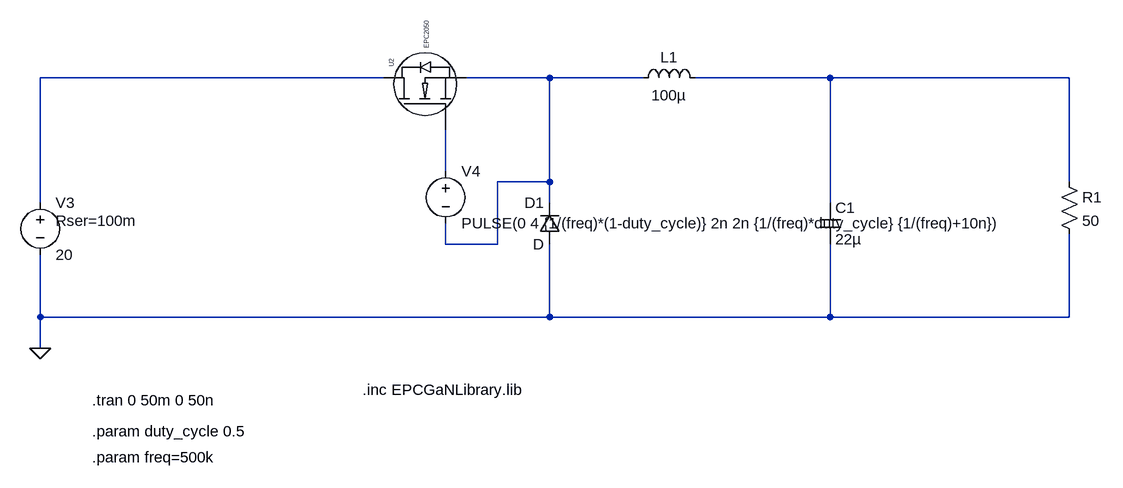
[diagram p0: schematic EPC_buck.asc]
EPC_buck.asc, the LTspice schematic file:
Version 4.1
SHEET 1 1836 868
WIRE 48 -368 -480 -368
WIRE 304 -368 176 -368
WIRE 448 -368 304 -368
WIRE 736 -368 528 -368
WIRE 1104 -368 736 -368
WIRE 144 -224 144 -288
WIRE 304 -208 304 -368
WIRE 304 -208 224 -208
WIRE 1104 -208 1104 -368
WIRE -480 -176 -480 -368
WIRE 304 -176 304 -208
WIRE 736 -176 736 -368
WIRE 144 -112 144 -144
WIRE 224 -112 224 -208
WIRE 224 -112 144 -112
WIRE -480 0 -480 -96
WIRE 304 0 304 -112
WIRE 304 0 -480 0
WIRE 736 0 736 -112
WIRE 736 0 304 0
WIRE 1104 0 1104 -128
WIRE 1104 0 736 0
WIRE -480 48 -480 0
FLAG -480 48 0
SYMBOL EPCGaNLibrary\\EPCGaN 144 -288 R270
SYMATTR InstName U2
SYMATTR Value EPC2050
SYMBOL ind 432 -352 R270
WINDOW 0 32 56 VTop 2
WINDOW 3 5 56 VBottom 2
SYMATTR InstName L1
SYMATTR Value 100µ
SYMATTR SpiceLine Rser=1m
SYMBOL diode 320 -112 R180
WINDOW 0 24 64 Left 2
WINDOW 3 24 0 Left 2
SYMATTR InstName D1
SYMBOL cap 720 -176 R0
SYMATTR InstName C1
SYMATTR Value 22µ
SYMBOL voltage -480 -192 R0
WINDOW 123 0 0 Left 0
WINDOW 39 24 44 Left 2
SYMATTR InstName V3
SYMATTR Value 20
SYMATTR SpiceLine Rser=100m
SYMBOL voltage 144 -240 R0
WINDOW 123 0 0 Left 0
WINDOW 39 0 0 Left 0
SYMATTR InstName V4
SYMATTR Value PULSE(0 4 {1/(freq)*(1-duty_cycle)} 2n 2n {1/(freq)*duty_cycle} {1/(freq)+10n})
SYMBOL res 1088 -224 R0
SYMATTR InstName R1
SYMATTR Value 50
TEXT 16 112 Left 2 !.inc EPCGaNLibrary.lib
TEXT -400 128 Left 2 !.tran 0 50m 0 50n
TEXT -400 176 Left 2 !.param duty_cycle 0.5
TEXT -400 216 Left 2 !.param freq=500k

The netlist it stands for:
* EPC_buck.asc
X§U2 N004 N001 N002 EPC2050  ; pins gatein drainin N_0
L1 N002 N003 100µ Rser=1m
D1 0 N002 D
C1 N003 0 22µ
V3 N001 0 20 Rser=100m
V4 N004 N002 PULSE(0 4 {1/(freq)*(1-duty_cycle)} 2n 2n {1/(freq)*duty_cycle} {1/(freq)+10n})
R1 N003 0 50
.model D D
.lib standard.dio
.inc EPCGaNLibrary.lib
.tran 0 50m 0 50n
.param duty_cycle 0.5
.param freq=500k
.lib EPCGanlibrary.lib
.backanno
.end